# Altium schematic sheet ToneGenerator.SchDoc
size A4; SheetNumber: 1; SheetTotal: 2
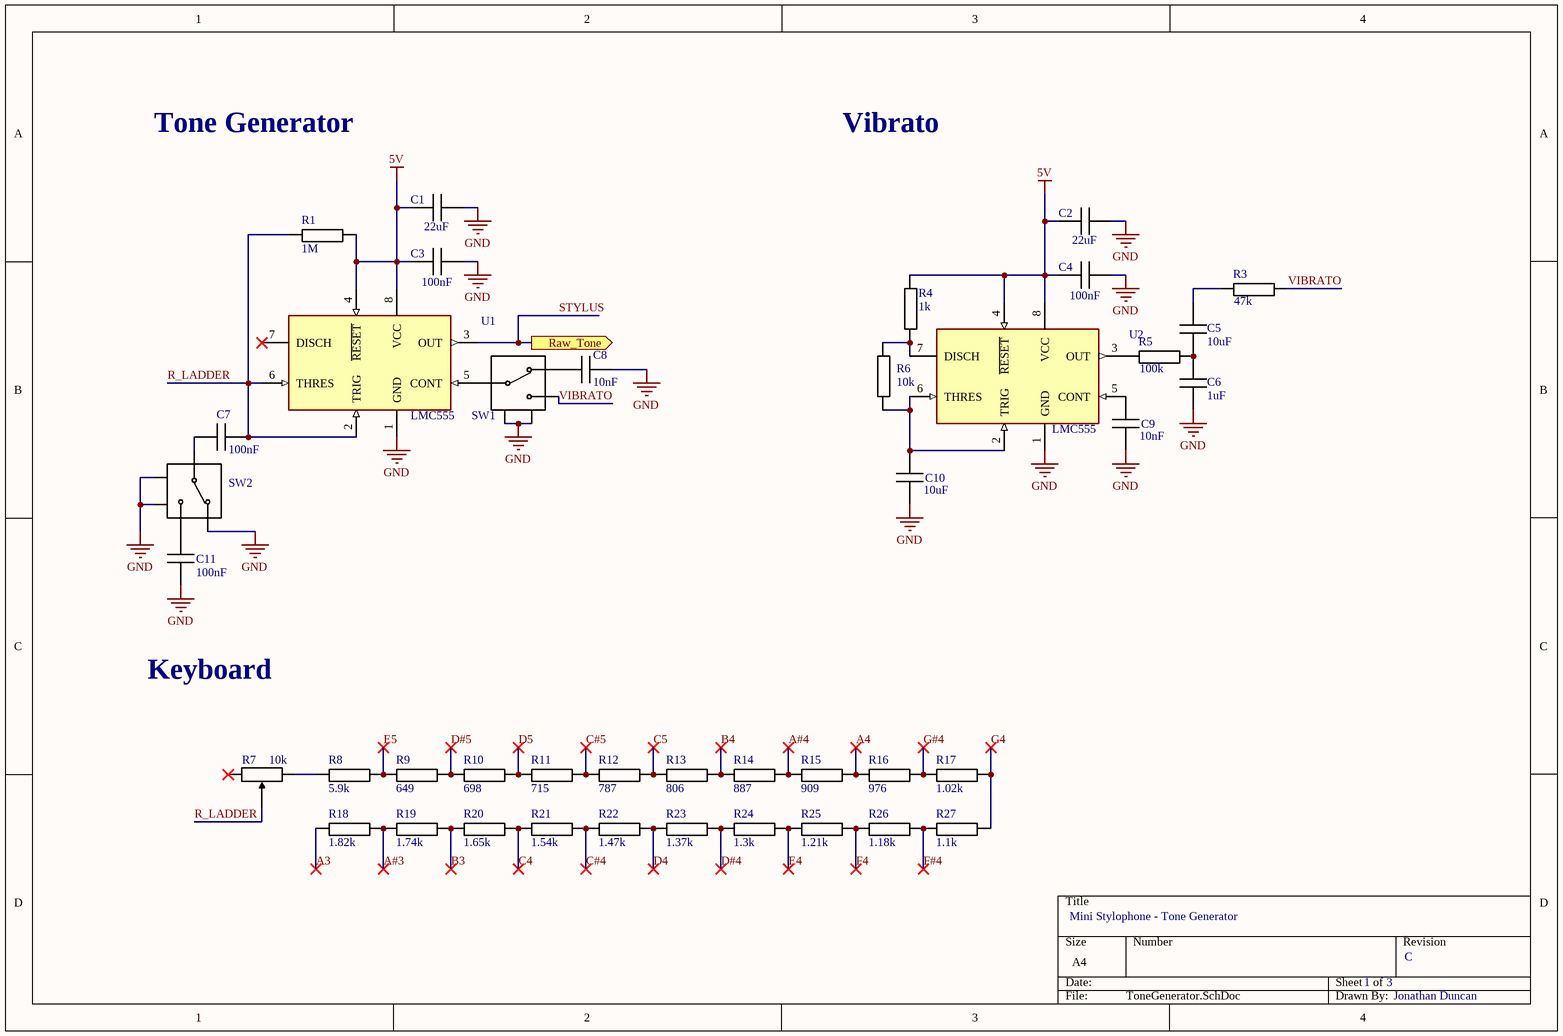
[diagram p0: ToneGenerator.SchDoc]

## Parts
C1  value 22uF  [FP-CC0603-DA-IPC_B]  (hidden comment: Cap 22uF 0603)
C2  value 22uF  [FP-CC0603-DA-IPC_B]  (hidden comment: Cap 22uF 0603)
C3  value 100nF  [FP-CC0603-DA-IPC_B]  (hidden comment: Cap 100nF 0603)
C4  value 100nF  [FP-CC0603-DA-IPC_B]  (hidden comment: Cap 100nF 0603)
C5  value 10uF  [FP-CC0603-DA-IPC_B]  (hidden comment: Cap 10uF 0603)
C6  value 1uF  [FP-CC0603-DA-IPC_B]  (hidden comment: Cap 1uF 0603)
C7  value 100nF  [FP-CC0603-DA-IPC_B]  (hidden comment: Cap 100nF 0603)
C8  value 10nF  [FP-CC0603-DA-IPC_B]  (hidden comment: Cap 10nF 0603)
C9  value 10nF  [FP-CC0603-DA-IPC_B]  (hidden comment: Cap 10nF 0603)
C10  value 10uF  [FP-CC0603-DA-IPC_B]  (hidden comment: Cap 10uF 0603)
C11  value 100nF  [FP-CC0603-DA-IPC_B]  (hidden comment: Cap 100nF 0603)
R1  value 1M  [FP-RC0603-0_55-IPC_B]  (hidden comment: Res 1M 0603)
R3  value 47k  [FP-RC0603-0_55-IPC_B]  (hidden comment: Res 47k 0603)
R4  value 1k  [FP-RC0603-0_55-IPC_B]  (hidden comment: Res 1k 0603)
R5  value 100k  [FP-RC0603-0_55-IPC_B]  (hidden comment: Res 100k 0603)
R6  value 10k  [FP-RC0603-0_55-IPC_B]  (hidden comment: Res 10k 0603)
R7  value 10k  [BOUR-TC33X-2_V]  (hidden comment: TC33X-2-103E)
R8  value 5.9k  [FP-RC0603-0_55-IPC_B]  (hidden comment: Res 5k1 0603)
R9  value 649  [FP-RC0603-0_55-IPC_B]  (hidden comment: Res 620R 0603)
R10  value 698  [FP-RC0603-0_55-IPC_B]  (hidden comment: Res 680R 0603)
R11  value 715  [FP-RC0603-0_55-IPC_B]  (hidden comment: Res 750R 0603)
R12  value 787  [FP-RC0603-0_55-IPC_B]  (hidden comment: Res 750R 0603)
R13  value 806  [FP-RC0603-0_55-IPC_B]  (hidden comment: Res 820R 0603)
R14  value 887  [FP-RC0603-0_55-IPC_B]  (hidden comment: Res 910R 0603)
R15  value 909  [FP-RC0603-0_55-IPC_B]  (hidden comment: Res 910R 0603)
R16  value 976  [FP-RC0603-0_55-IPC_B]  (hidden comment: Res 1k 0603)
R17  value 1.02k  [FP-RC0603-0_55-IPC_B]  (hidden comment: Res 1k 0603)
R18  value 1.82k  [FP-RC0603-0_55-IPC_B]  (hidden comment: Res 1k8 0603)
R19  value 1.74k  [FP-RC0603-0_55-IPC_B]  (hidden comment: Res 1k8 0603)
R20  value 1.65k  [FP-RC0603-0_55-IPC_B]  (hidden comment: Res 1k6 0603)
R21  value 1.54k  [FP-RC0603-0_55-IPC_B]  (hidden comment: Res 1k5 0603)
R22  value 1.47k  [FP-RC0603-0_55-IPC_B]  (hidden comment: Res 1k5 0603)
R23  value 1.37k  [FP-RC0603-0_55-IPC_B]  (hidden comment: Res 1k3 0603)
R24  value 1.3k  [FP-RC0603-0_55-IPC_B]  (hidden comment: Res 1k3 0603)
R25  value 1.21k  [FP-RC0603-0_55-IPC_B]  (hidden comment: Res 1k3 0603)
R26  value 1.18k  [FP-RC0603-0_55-IPC_B]  (hidden comment: Res 1k1 0603)
R27  value 1.1k  [FP-RC0603-0_55-IPC_B]  (hidden comment: Res 1k1 0603)
SW1  SS12D07VG4 087  [SS12D07VG4 087-Footprint-1]  (value not drawn)
SW2  SS12D07VG4 087  [SS12D07VG4 087-Footprint-1]  (value not drawn)
U1  LMC555  [FP-D0008A-IPC_B]
U2  LMC555  [FP-D0008A-IPC_B]

## Ports
Raw_Tone (out, see Amplifier[1B])

## Nets
5V: C1.1 C2.1 C3.1 C4.1 R1.2 R4.2 U1.4(~{RESET}) U1.8(VCC) U2.4(~{RESET}) U2.8(VCC)
GND: C1.2 C2.2 C3.2 C4.2 C6.1 C8.1 C9.1 C10.1 C11.2 SW1.4 SW1.5 SW2.1 SW2.4 SW2.5 U1.1(GND) U2.1(GND)
A3: R18.1
A4: R15.2 R16.1
A#3: R18.2 R19.1
A#4: R14.2 R15.1
B3: R19.2 R20.1
B4: R13.2 R14.1
C4: R20.2 R21.1
C5: R12.2 R13.1
C#4: R21.2 R22.1
C#5: R11.2 R12.1
D4: R22.2 R23.1
D5: R10.2 R11.1
D#4: R23.2 R24.1
D#5: R9.2 R10.1
E4: R24.2 R25.1
E5: R8.2 R9.1
F4: R25.2 R26.1
F#4: R26.2 R27.1
G4: R17.2 R27.2
G#4: R16.2 R17.1
R_LADDER: C7.1 R1.1 R7.2 U1.2(TRIG) U1.6(THRES)
STYLUS: U1.3(OUT) ; port Raw_Tone
VIBRATO: R3.2 SW1.3
NetC5_1: C5.1 C6.2 R5.2
NetC5_2: C5.2 R3.1
NetC7_2: C7.2 SW2.2
NetC8_2: C8.2 SW1.1
NetC9_2: C9.2 U2.5(CONT)
NetC10_2: C10.2 R6.1 U2.2(TRIG) U2.6(THRES)
NetC11_1: C11.1 SW2.3
NetR4_1: R4.1 R6.2 U2.7(DISCH)
NetR5_1: R5.1 U2.3(OUT)
NetR7_3: R7.3 R8.1
NetSW1_2: SW1.2 U1.5(CONT)

Not connected (* = marked no-connect by the designer): R7 1*; U1 7(DISCH)*

## Notes on the sheet
- Tone Generator
- Vibrato
- Keyboard
- Mini Stylophone - Tone Generator
- 1
- 3
- C
- Jonathan Duncan

## Library data of the parts
C1 C2 = CMP-001-00003-1: 22uF 6.3V 20% X5R 0603 SMD Capacitor; Case/Package: 0603; Mounting Technology: SMT; Voltage Rating: 6.3V; Tolerance: 20%; Temperature Coefficient: X5R
C3 C4 C7 C11 = CMP-00006-5: 100nF 50V 10% X7R 0603 SMD Capacitor Decoupling; Temperature Coefficient: X7R; Mounting Technology: SMT; Tolerance: 10%; Case/Package: 0603; Voltage Rating: 50V
C5 C10 = CMP-001-00002-1: 10uF 6.3V 10% X5R 0603 SMD Capacitor; Mounting Technology: SMT; Voltage Rating: 6.3V; Case/Package: 0603; Tolerance: 10%; Temperature Coefficient: X5R
C6 = CMP-001-00001-2: 1uF 25V 10% X5R 0603 SMD Capacitor; Temperature Coefficient: X5R; Case/Package: 0603; Voltage Rating: 25V; Tolerance: 10%; Mounting Technology: SMT
C8 C9 = CMP-001-00000-5: 10nF 50V 10% X7R 0603 SMD Capacitor; Case/Package: 0603; Tolerance: 10%; Temperature Coefficient: X7R; Voltage Rating: 50V; Mounting Technology: SMT
R1 = CMP-009-00021-1: 1M 1% 100mW 0603 SMD Resistor; Case/Package: 0603; Tolerance: 1%; Mounting Technology: SMT; Power Rating: 100mW
R3 = CMP-009-00004-1: 47k 1% 100mW 0603 SMD Resistor; Tolerance: 1%; Case/Package: 0603; Mounting Technology: SMT; Power Rating: 100mW
R4 R16 R17 = CMP-00011-1: 1k 1% 100mW 0603 SMD Resistor; Tolerance: 1%; Case/Package: 0603; Mounting Technology: SMT; Power Rating: 100mW
R5 = CMP-009-00003-1: 100k 1% 100mW 0603 SMD Resistor; Power Rating: 100mW; Case/Package: 0603; Mounting Technology: SMT; Tolerance: 1%
R6 = CMP-009-00000-1: 10k 1% 100mW 0603 SMD Resistor; Case/Package: 0603; Power Rating: 100mW; Mounting Technology: SMT; Tolerance: 1%
R7 = CMP-00022-2: SMD 3mm Cermet Trimmer - Leadfree 3MM 10KOHMS 25% 0.1WATT OPEN FRM; Mounting Technology: SMT
R8 = CMP-009-00005-1: 5.1k 1% 100mW 0603 SMD Resistor; Power Rating: 100mW; Mounting Technology: SMT; Tolerance: 1%; Case/Package: 0603
R9 = CMP-009-00006-1: 620R 1% 100mW 0603 SMD Resistor; Tolerance: 1%; Mounting Technology: SMT; Power Rating: 100mW; Case/Package: 0603
R10 = CMP-009-00015-1: 680R 1% 100mW 0603 SMD Resistor; Mounting Technology: SMT; Power Rating: 100mW; Tolerance: 1%; Case/Package: 0603
R11 R12 = CMP-009-00007-2: 750R 1% 100mW 0603 SMD Resistor; Tolerance: 1%; Case/Package: 0603; Mounting Technology: SMT; Power Rating: 100mW
R13 = CMP-009-00008-1: 820R 1% 100mW 0603 SMD Resistor; Case/Package: 0603; Mounting Technology: SMT; Tolerance: 1%; Power Rating: 100mW
R14 R15 = CMP-009-00009-1: 910R 1% 100mW 0603 SMD Resistor; Case/Package: 0603; Mounting Technology: SMT; Tolerance: 1%; Power Rating: 100mW
R18 R19 = CMP-009-00014-1: 1.8k 1% 100mW 0603 SMD Resistor; Case/Package: 0603; Mounting Technology: SMT; Tolerance: 1%; Power Rating: 100mW
R20 = CMP-009-00013-1: 1.6k 1% 100mW 0603 SMD Resistor; Mounting Technology: SMT; Tolerance: 1%; Case/Package: 0603; Power Rating: 100mW
R21 R22 = CMP-009-00012-1: 1.5k 1% 100mW 0603 SMD Resistor; Power Rating: 100mW; Tolerance: 1%; Mounting Technology: SMT; Case/Package: 0603
R23-R25 = CMP-009-00011-2: 1.3k 1% 100mW 0603 SMD Resistor; Tolerance: 1%; Case/Package: 0603; Mounting Technology: SMT; Power Rating: 100mW
R26 R27 = CMP-009-00010-1: 1.1k 1% 100mW 0603 SMD Resistor; Power Rating: 100mW; Tolerance: 1%; Case/Package: 0603; Mounting Technology: SMT
SW1 SW2 = CMP-002-000001-2: Direct Insert 500mA Single Pole Double Throw (SPDT) 50V 5 Thousand Times Plugin Slide Switches ROHS
U1 U2 = CMP-001-0000-1: Single Precision Timer 8-SOIC 0 to 70; Max Supply Voltage: 15V; Min Supply Voltage: 1.5V; Pins: 8; Case/Package: SOIC; Mounting Technology: SMT